# Altium schematic sheet PCL-01.SchDoc
size Tabloid; SheetNumber: 1; SheetTotal: 4
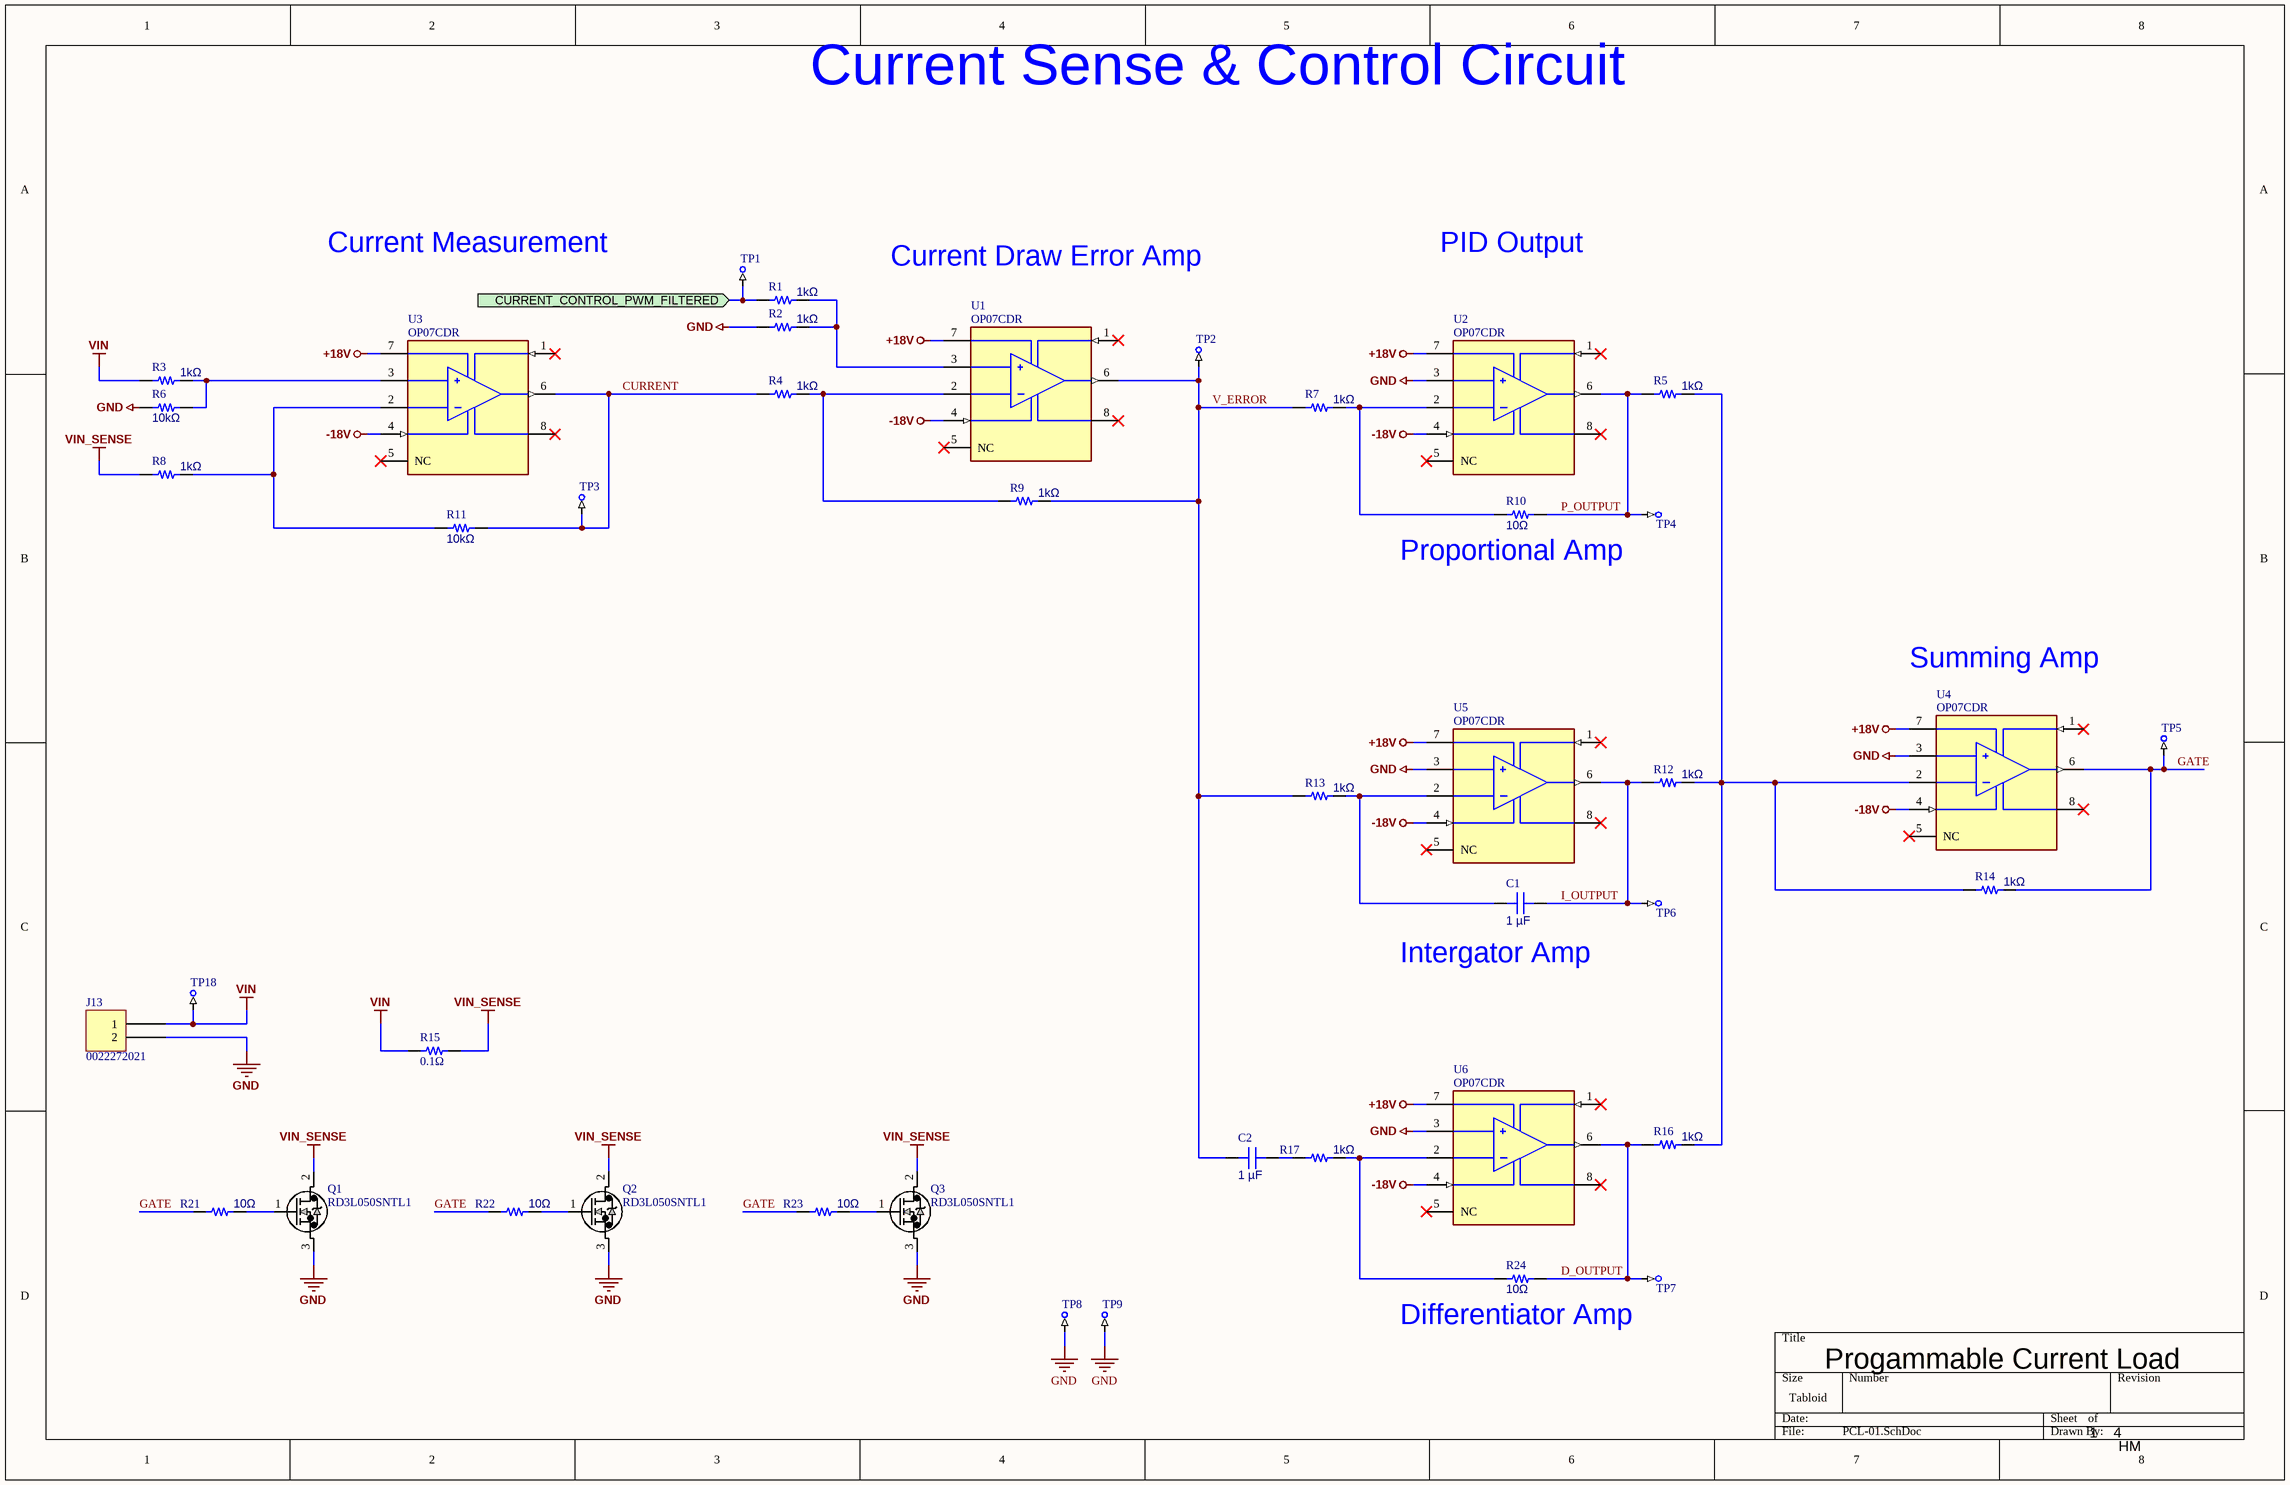
[diagram p0: PCL-01.SchDoc]

## Parts
C1  1 µF  [CAP 0805_2012]
C2  1 µF  [CAP 0805_2012]
J13  0022272021  [MOLEX KK 0022272021]
Q1  RD3L050SNTL1  [TRANS_RD3H045S_ROM]
Q2  RD3L050SNTL1  [TRANS_RD3H045S_ROM]
Q3  RD3L050SNTL1  [TRANS_RD3H045S_ROM]
R1  1kΩ  [RES 0805_2012]
R2  1kΩ  [RES 0805_2012]
R3  1kΩ  [RES 0805_2012]
R4  1kΩ  [RES 0805_2012]
R5  1kΩ  [RES 0805_2012]
R6  10kΩ  [RES 0805_2012]
R7  1kΩ  [RES 0805_2012]
R8  1kΩ  [RES 0805_2012]
R9  1kΩ  [RES 0805_2012]
R10  10Ω  [RES 0805_2012]
R11  10kΩ  [RES 0805_2012]
R12  1kΩ  [RES 0805_2012]
R13  1kΩ  [RES 0805_2012]
R14  1kΩ  [RES 0805_2012]
R15  0.1Ω  [RES 2512_6432]
R16  1kΩ  [RES 0805_2012]
R17  1kΩ  [RES 0805_2012]
R21  10Ω  [RES 0603_1608]
R22  10Ω  [RES 0603_1608]
R23  10Ω  [RES 0603_1608]
R24  10Ω  [RES 0805_2012]
TP1  5016  [KEYSTONE-5016_V]  (value not drawn)
TP2  5016  [KEYSTONE-5016_V]  (value not drawn)
TP3  5016  [KEYSTONE-5016_V]  (value not drawn)
TP4  5016  [KEYSTONE-5016_V]  (value not drawn)
TP5  5016  [KEYSTONE-5016_V]  (value not drawn)
TP6  5016  [KEYSTONE-5016_V]  (value not drawn)
TP7  5016  [KEYSTONE-5016_V]  (value not drawn)
TP8  5016  [KEYSTONE-5016_V]  (value not drawn)
TP9  5016  [KEYSTONE-5016_V]  (value not drawn)
TP18  5016  [KEYSTONE-5016_V]  (value not drawn)
U1  OP07CDR  [FP-D0008A-MFG]
U2  OP07CDR  [FP-D0008A-MFG]
U3  OP07CDR  [FP-D0008A-MFG]
U4  OP07CDR  [FP-D0008A-MFG]
U5  OP07CDR  [FP-D0008A-MFG]
U6  OP07CDR  [FP-D0008A-MFG]

## Ports
CURRENT_CONTROL_PWM_FILTERED (in, see PCL-02[5D])

## Nets
+18V: U1.7(VCC+) U2.7(VCC+) U3.7(VCC+) U4.7(VCC+) U5.7(VCC+) U6.7(VCC+)
-18V: U1.4(VCC-) U2.4(VCC-) U3.4(VCC-) U4.4(VCC-) U5.4(VCC-) U6.4(VCC-)
GND: J13.2 Q1.3 Q2.3 Q3.3 R2.1 R6.1 TP8.1 TP9.1 U2.3(IN+) U4.3(IN+) U5.3(IN+) U6.3(IN+)
VIN: J13.1 R3.1 R15.2 TP18.1
VIN_SENSE: Q1.2 Q2.2 Q3.2 R8.1 R15.1
CURRENT: R4.1 R11.2 TP3.1 U3.6(OUT)
CURRENT_CONTROL_PWM_FILTERED: R1.1 TP1.1 ; port CURRENT_CONTROL_PWM_FILTERED
D_OUTPUT: R16.1 R24.2 TP7.1 U6.6(OUT)
GATE: R14.2 R21.1 R22.1 R23.1 TP5.1 U4.6(OUT)
I_OUTPUT: C1.2 R12.1 TP6.1 U5.6(OUT)
P_OUTPUT: R5.1 R10.2 TP4.1 U2.6(OUT)
V_ERROR: C2.1 R7.1 R9.2 R13.1 TP2.1 U1.6(OUT)
NetC1_1: C1.1 R13.2 U5.2(IN-)
NetC2_2: C2.2 R17.1
NetQ1_1: Q1.1 R21.2
NetQ2_1: Q2.1 R22.2
NetQ3_1: Q3.1 R23.2
NetR1_2: R1.2 R2.2 U1.3(IN+)
NetR3_2: R3.2 R6.2 U3.3(IN+)
NetR4_2: R4.2 R9.1 U1.2(IN-)
NetR5_2: R5.2 R12.2 R14.1 R16.2 U4.2(IN-)
NetR7_2: R7.2 R10.1 U2.2(IN-)
NetR8_2: R8.2 R11.1 U3.2(IN-)
NetR17_2: R17.2 R24.1 U6.2(IN-)

Not connected (* = marked no-connect by the designer): U1 1(OFFSET_N1)* 5(NC)* 8*; U2 1(OFFSET_N1)* 5(NC)* 8*; U3 1(OFFSET_N1)* 5(NC)* 8*; U4 1(OFFSET_N1)* 5(NC)* 8*; U5 1(OFFSET_N1)* 5(NC)* 8*; U6 1(OFFSET_N1)* 5(NC)* 8*

## Notes on the sheet
- Current Sense & Control Circuit
- Current Measurement
- Current Draw Error Amp
- PID Output
- Proportional Amp
- Summing Amp
- (near C1) Intergator Amp
- Differentiator Amp
- Progammable Current Load
- 1
- 4
- HM

## Library data of the parts
C1 C2 = 0805X105K500CT: CAP CER 1UF 50V X5R 0805; manufacturer: Walsin Technology Corporation; Tolerance: ±10%; Part Number: 0805X105K500CT; Capacitance: 1 µF; Applications: General Purpose; componentlink1description: Datasheet; componentlink1url: https://www.passivecomponent.com/wp-content/uploads/datasheet/WTC_MLCC_General_Purpose.pdf; componentlink2description: DigiKey Link; componentlink2url: https://www.digikey.com/en/products/detail/walsin-technology-corporation/0805X105K500CT/15978747; Device Package: 0805 (2012 Metric); lastupdated: 2026-04-06 7:30:03 PM; Lifecycle Status: Active; Minimum Order: 1; Mounting Type: Surface Mount, MLCC; Operating Temperature: -55°C ~ 85°C; Package / Case: 0805 (2012 Metric); packaging: TapeAndReel; partid: 55928; price: 0.01; series: -; Size / Dimension: 0.079" L x 0.049" W (2.00mm x 1.25mm); Supplier 1: DigiKey; Supplier Part Number 1: 1292-0805X105K500CT-ND; Temperature Coefficient: X5R; Thickness (Max): 0.057" (1.45mm); value: 1 µF; Voltage - Rated: 50V
J13 = 0022272021: CONN HEADER VERT 2POS 2.54MM; Manufacturer: Molex; Contact Length - Mating: 0.295" (7.49mm); Contact Length - Post: 0.140" (3.56mm); Material Flammability Rating: UL94 V-0; Number of Positions: 2; Number of Positions Loaded: All; Overall Contact Length: 0.560" (14.22mm); Pitch - Mating: 0.100" (2.54mm); Shrouding: Shrouded - 1 Wall; Style: Board to Cable/Wire; Part Number: 0022272021; ComponentLink1Description: Datasheet; ComponentLink1URL: https://www.molex.com/pdm_docs/sd/022272021_sd.pdf; ComponentLink2Description: DigiKey Link; ComponentLink2URL: http://digikey.com/product-detail/en/molex/0022272021/WM4111-ND/1130577; Connector Type: Header; Contact Finish - Mating: Tin; Contact Finish - Post: Tin; Contact Finish Thickness - Mating: 100.0µin (2.54µm); Contact Material: Brass; Contact Shape: Square; Contact Type: Male Pin; Fastening Type: Friction Lock; Insulation Color: Natural; Insulation Height: 0.461" (11.70mm); Insulation Material: Polyamide (PA), Nylon; LastUpdated: 2020-01-12 11:51:43 PM; Lifecycle Status: Active; Minimum Order: 1; Mounting Type: Through Hole; Number of Rows: 1; Packaging: Bulk; PartId: 76; Part Status: Active; Price: 0.27; Series: KK 6410; Supplier 1: DigiKey; Supplier Part Number 1: WM4111-ND; Termination: Solder
Q1-Q3 = RD3L050SNTL1: Description; Manufacturer_Name: ROHM Semiconductor; Copyright: Copyright (C) 2026 Ultra Librarian. All rights reserved.; Manufacturer_Part_Number: RD3L050SNTL1
R1-R5 R7-R9 R12-R14 R16 R17 = 1-2176092-8: RES SMD 1K OHM 0.1% 1/4W 0805; Manufacturer: TE Connectivity Passive Product; Power (Watts): 0.25W, 1/4W; Resistance: 1 kOhms; Temperature Coefficient: ±25ppm/°C; Part Number: 1-2176092-8; Value: 1kΩ; ComponentLink1Description: Datasheet; ComponentLink1URL: https://www.te.com/commerce/DocumentDelivery/DDEController?Action=srchrtrv&DocNm=1773272&DocType=DS&DocLang=English; ComponentLink2Description: DigiKey Link; ComponentLink2URL: https://www.digikey.com/en/products/detail/te-connectivity-passive-product/1-2176092-8/4034011; Composition: Thin Film; Device Package: 0805 (2012 Metric); Height - Seated (Max): 0.026" (0.65mm); LastUpdated: 2026-04-05 8:11:23 PM; Lifecycle Status: Active; Minimum Order: 1; Number of Terminations: 2; Operating Temperature: -55°C ~ 155°C; Package / Case: 0805 (2012 Metric); Packaging: TapeAndReel; PartId: 28484; Part Status: Active; Price: 0.13; Series: RP73P, Holsworthy; Size / Dimension: 0.079" L x 0.049" W (2.00mm x 1.25mm); Supplier 1: DigiKey; Supplier Part Number 1: A110543CT-ND; Supplier Device Package: 0805; Tolerance: ±0.1%
R6 R11 = RNCS0805BKE10K0: RES 10K OHM 0.1% 1/10W 0805; Manufacturer: Stackpole Electronics Inc; Power (Watts): 0.1W, 1/10W; Resistance: 10 kOhms; Temperature Coefficient: ±25ppm/°C; Part Number: RNCS0805BKE10K0; Value: 10kΩ; ComponentLink1Description: Datasheet; ComponentLink1URL: https://www.seielect.com/catalog/sei-rncs_rnch.pdf; ComponentLink2Description: DigiKey Link; ComponentLink2URL: https://www.digikey.com/en/products/detail/stackpole-electronics-inc/RNCS0805BKE10K0/1800067; Composition: Thin Film; Device Package: 0805 (2012 Metric); Features: Anti-Corrosive, Automotive AEC-Q200, Moisture Resistant; Height - Seated (Max): 0.026" (0.65mm); LastUpdated: 2026-04-05 8:11:26 PM; Lifecycle Status: Active; Minimum Order: 1; Number of Terminations: 2; Operating Temperature: -55°C ~ 155°C; Package / Case: 0805 (2012 Metric); Packaging: TapeAndReel; PartId: 27713; Part Status: Active; Price: 0.07; Ratings: AEC-Q200; Series: RNCS; Size / Dimension: 0.079" L x 0.049" W (2.00mm x 1.25mm); Supplier 1: DigiKey; Supplier Part Number 1: RNCS0805BKE10K0CT-ND; Supplier Device Package: 0805; Tolerance: ±0.1%
R10 R24 = RNCS0805BKE10R0: RES 10 OHM 0.1% 1/10W 0805; Manufacturer: Stackpole Electronics Inc; Power (Watts): 0.1W, 1/10W; Resistance: 10 Ohms; Temperature Coefficient: ±25ppm/°C; Part Number: RNCS0805BKE10R0; Value: 10Ω; ComponentLink1Description: Datasheet; ComponentLink1URL: https://www.seielect.com/catalog/sei-rncs_rnch.pdf; ComponentLink2Description: DigiKey Link; ComponentLink2URL: https://www.digikey.com/en/products/detail/stackpole-electronics-inc/RNCS0805BKE10R0/1800064; Composition: Thin Film; Device Package: 0805 (2012 Metric); Features: Anti-Corrosive, Automotive AEC-Q200, Moisture Resistant; Height - Seated (Max): 0.026" (0.65mm); LastUpdated: 2026-04-05 8:11:26 PM; Lifecycle Status: Active; Minimum Order: 1; Number of Terminations: 2; Operating Temperature: -55°C ~ 155°C; Package / Case: 0805 (2012 Metric); Packaging: TapeAndReel; PartId: 27711; Part Status: Active; Price: 0.07; Ratings: AEC-Q200; Series: RNCS; Size / Dimension: 0.079" L x 0.049" W (2.00mm x 1.25mm); Supplier 1: DigiKey; Supplier Part Number 1: RNCS0805BKE10R0CT-ND; Supplier Device Package: 0805; Tolerance: ±0.1%
R15 = CSRL3-0R1F8: RES 0.1 OHM 1% 3W 2512; manufacturer: Riedon; Resistance: 100 mOhms; Temperature Coefficient: ±75ppm/°C; value: 100 mOhms; Part Number: CSRL3-0R1F8; componentlink1description: Datasheet; componentlink1url: https://riedon.com/media/pdf/CSRL.pdf; componentlink2description: DigiKey Link; componentlink2url: http://digikey.com/product-detail/en/riedon/CSRL3-0R1F8/696-1842-1-ND/9666106; Composition: Metal Element; Device Package: 2512 (6432 Metric); Features: Current Sense, Non-Inductive; Height - Seated (Max): 0.035" (0.90mm); lastupdated: 2020-09-02 1:26:50 AM; Lifecycle Status: Active; Minimum Order: 1; Number of Terminations: 2; Operating Temperature: -55°C ~ 170°C; Package / Case: 2512 (6432 Metric); packaging: TapeAndReel; Part Status: Active; Power (Watts): 3W; price: 0.11; series: CSRL; Size / Dimension: 0.252" L x 0.126" W (6.40mm x 3.20mm); Supplier 1: DigiKey; Supplier Part Number 1: 696-1842-1-ND; Supplier Device Package: 2512; Tolerance: ±1%
R21-R23 = ESR03EZPF10R0: RES SMD 10 OHM 1% 1/4W 0603; Manufacturer: Rohm Semiconductor; Power (Watts): 0.25W, 1/4W; Resistance: 10 Ohms; Temperature Coefficient: ±100ppm/°C; Part Number: ESR03EZPF10R0; Value: 10Ω; ComponentLink1Description: Datasheet; ComponentLink1URL: https://www.rohm.com/datasheet/ESR01MZPF/esr-e; ComponentLink2Description: DigiKey Link; ComponentLink2URL: https://www.digikey.com/en/products/detail/rohm-semiconductor/ESR03EZPF10R0/1983431; Composition: Thick Film; Device Package: 0603 (1608 Metric); Features: Automotive AEC-Q200, Pulse Withstanding; Height - Seated (Max): 0.022" (0.55mm); LastUpdated: 2024-02-09 8:43:34 PM; Lifecycle Status: Active; Minimum Order: 1; Number of Terminations: 2; Operating Temperature: -55°C ~ 155°C; Package / Case: 0603 (1608 Metric); Packaging: TapeAndReel; PartId: 5471; Part Status: Active; Price: 0.02; Ratings: AEC-Q200; Series: ESR; Size / Dimension: 0.063" L x 0.031" W (1.60mm x 0.80mm); Supplier 1: DigiKey; Supplier Part Number 1: RHM10.0ADCT-ND; Supplier Device Package: 0603; Tolerance: ±1%
TP1-TP9 TP18 = CMP-2000-05178-1: Test Point, 1-Pin SMT, RoHS, Tape and Reel; Manufacturer: Keystone; Other Names: 5016KDKR; Featured Product: SurfaceMountTestPoints / 5019MiniatureSurfaceMountTestPoint; Online Catalog: SurfaceMountTestPoints; Catalog Drawings: 5016Top / 5016Side / 5016Front; Packaging: Digi-Reel; RoHS Information: RoHSComplianceStatement; Package Reference: 5016; Mounting Type: SurfaceMount; Type: PCTestPoint,Compact; Manufacturer URL: http://www.keyelco.com/; Standard Package: 1; Package Description: 1-Pin Test Point, Body 3.81 x 2.04 mm; Category: TestandMeasurement; Terminal: 0.015"(0.38mm)PhosphorBronze,SilverPlated; Datasheet URL: https://ciiva.com/datasheet-click-2917613?src=ciiva&sig=4a4e90f; Datasheet Version: Rev. D, 03/2014; Family: TestPoints; Material: PhosphorBronze
U1-U6 = CMP-0015-00070-3: IC OPAMP GP 1 CIRCUIT 8SOIC; Number of Circuits: 1; Dual Supply Voltage: 9V; Max I/O Voltage: 150uV; Max Dual Supply Voltage: 18V; Nominal Supply Current: 5mA; Bandwidth: 600kHz; Slew Rate: 0.3V/µs; Input Bias Current: 7nA; Min Dual Supply Voltage: 3V; Common Mode Rejection Ratio: 100dB; Voltage Gain: 112.04dB; Packaging: Tape and Reel; Min Operating Temperature: 0°C; REACH SVHC: No SVHC; Operating Supply Voltage: 18V; Package Quantity: 1; Number of Channels: 1; Number of Pins: 8; Number of Elements: 1; Lead Free: Lead Free; Gain Bandwidth Product: 600kHz; Nominal Gain Bandwidth Product: 600kHz; Unity Gain Bandwidth Product: 600kHz; Width: 3.91mm; Case/Package: D; Radiation Hardening: No; Input Offset Voltage (Vos): 150uV; Height: 1.58mm; Length: 4.9mm; Max Operating Temperature: 70°C; Number of Amplifiers: 1